# Altium schematic sheet Relay.SchDoc
size D; SheetNumber: 4; SheetTotal: 5
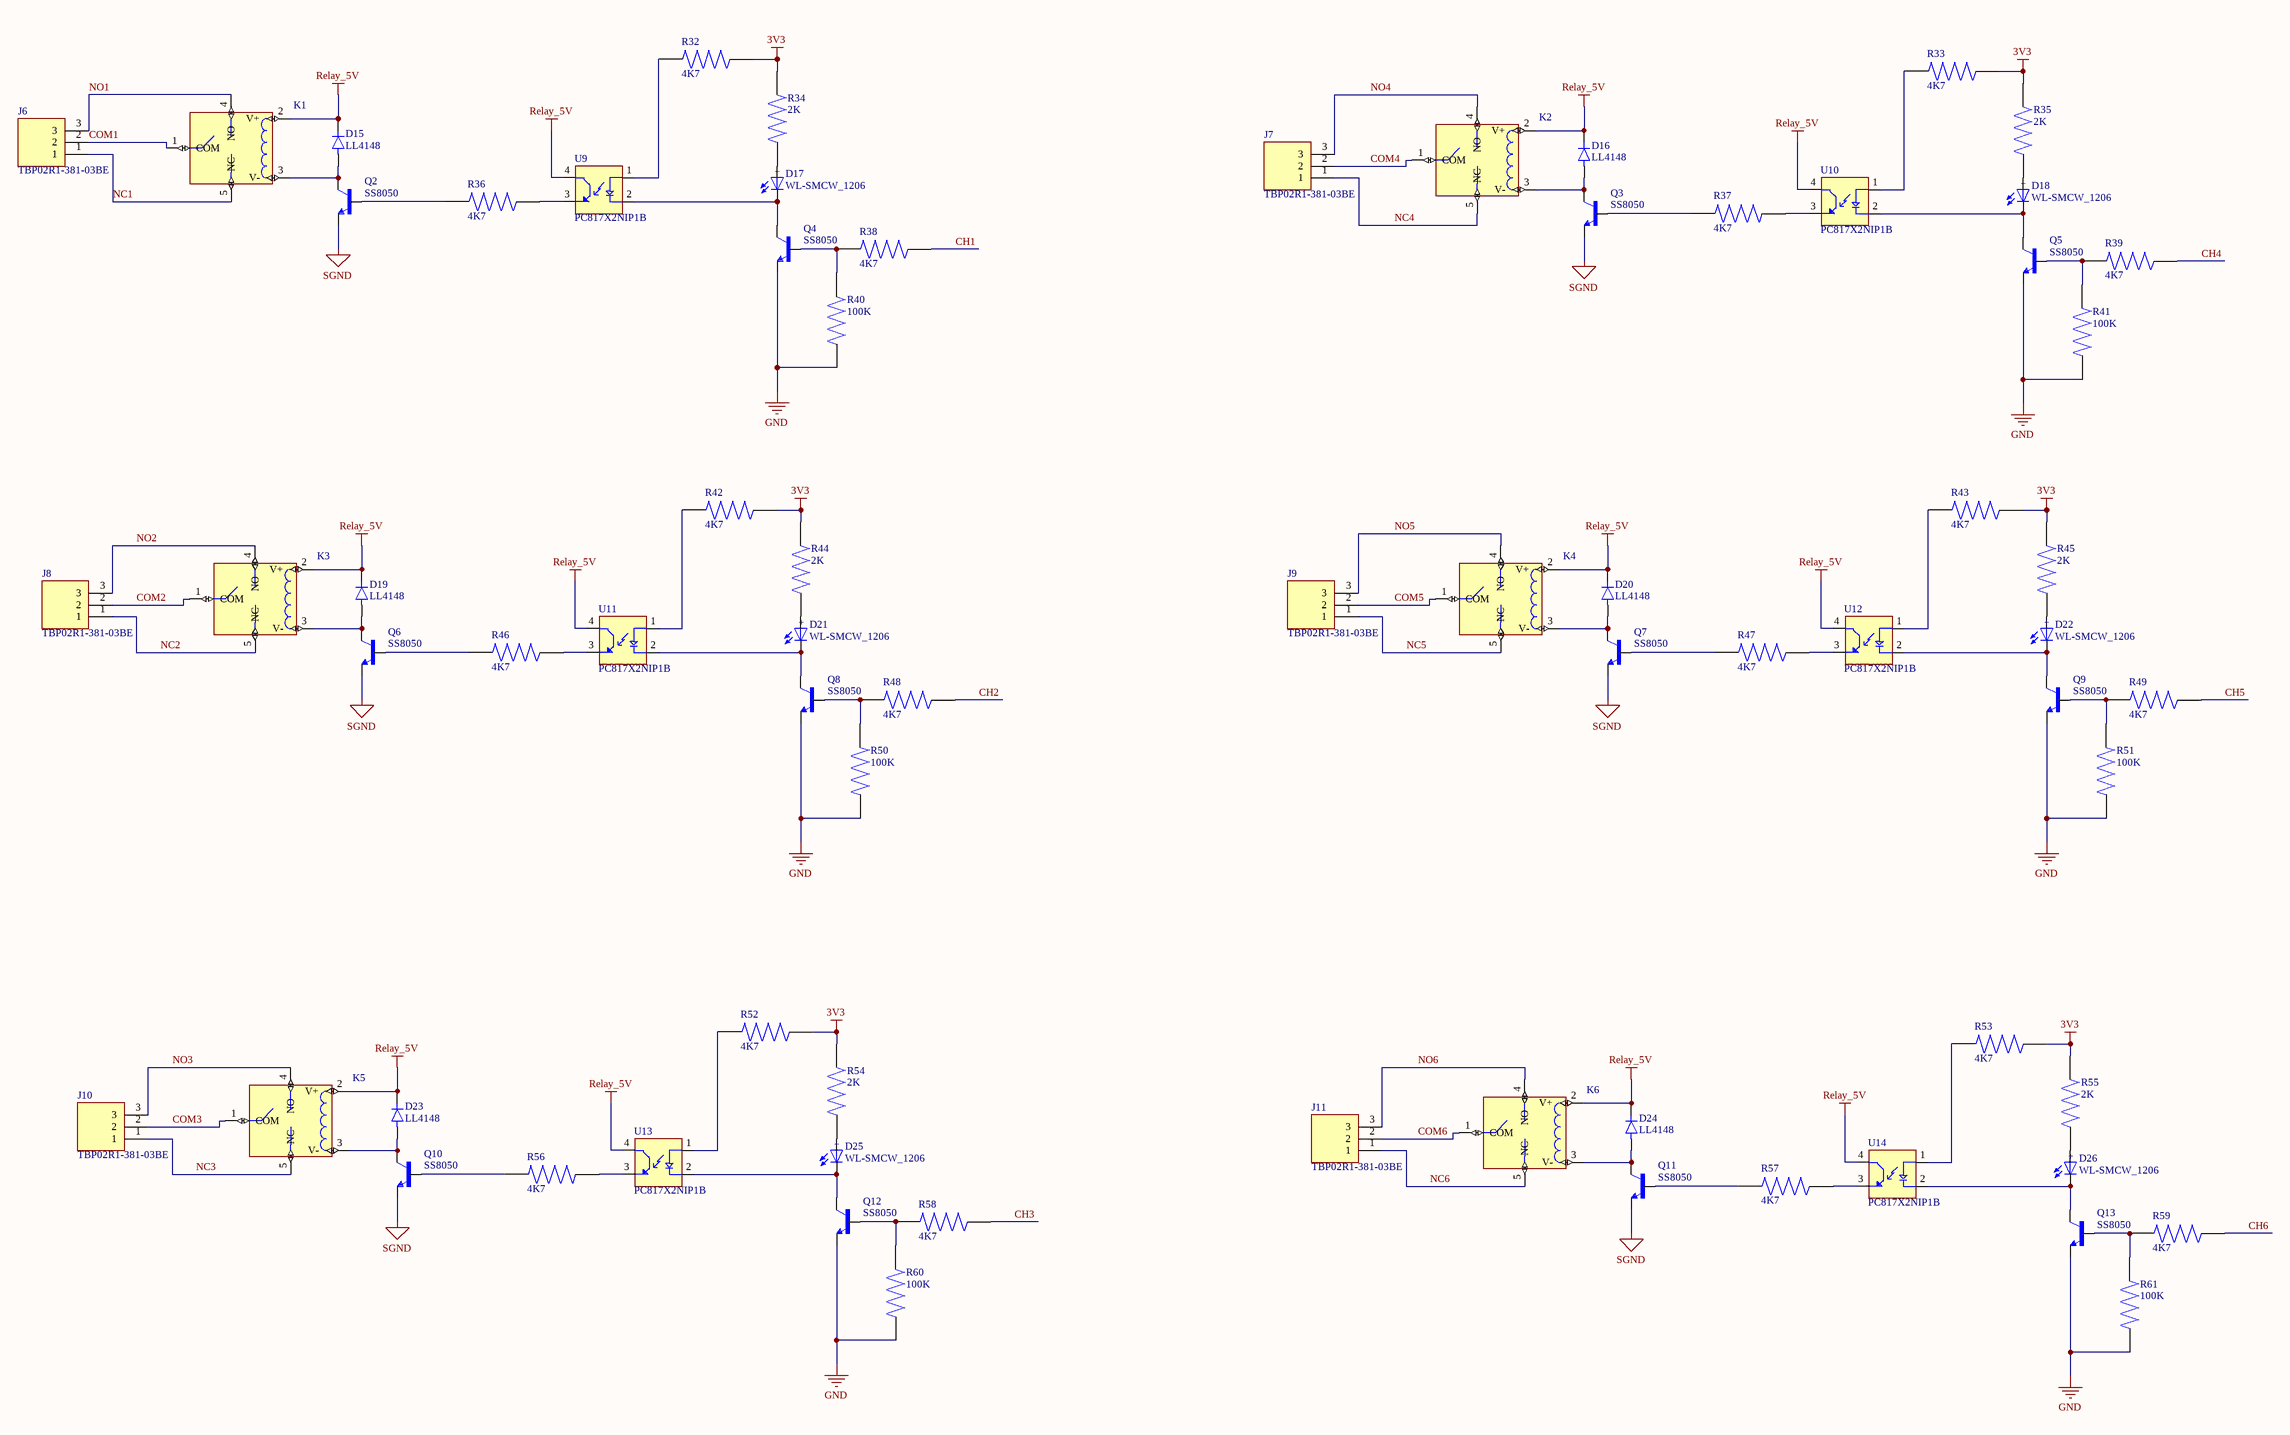
[diagram p0: Relay.SchDoc]

## Parts
D15  LL4148  [DIO_LL4148]
D16  LL4148  [DIO_LL4148]
D17  WL-SMCW_1206  [WL-SMCW_1206]
D18  WL-SMCW_1206  [WL-SMCW_1206]
D19  LL4148  [DIO_LL4148]
D20  LL4148  [DIO_LL4148]
D21  WL-SMCW_1206  [WL-SMCW_1206]
D22  WL-SMCW_1206  [WL-SMCW_1206]
D23  LL4148  [DIO_LL4148]
D24  LL4148  [DIO_LL4148]
D25  WL-SMCW_1206  [WL-SMCW_1206]
D26  WL-SMCW_1206  [WL-SMCW_1206]
J6  TBP02R1-381-03BE  [CUI_TBP02R1-381-03BE]
J7  TBP02R1-381-03BE  [CUI_TBP02R1-381-03BE]
J8  TBP02R1-381-03BE  [CUI_TBP02R1-381-03BE]
J9  TBP02R1-381-03BE  [CUI_TBP02R1-381-03BE]
J10  TBP02R1-381-03BE  [CUI_TBP02R1-381-03BE]
J11  TBP02R1-381-03BE  [CUI_TBP02R1-381-03BE]
K1  RELAY-HLS8L-DC5V-S-C(5P-19X15MM)  [REY5-19.0X15.0X15.0MM]  (value not drawn)
K2  RELAY-HLS8L-DC5V-S-C(5P-19X15MM)  [REY5-19.0X15.0X15.0MM]  (value not drawn)
K3  RELAY-HLS8L-DC5V-S-C(5P-19X15MM)  [REY5-19.0X15.0X15.0MM]  (value not drawn)
K4  RELAY-HLS8L-DC5V-S-C(5P-19X15MM)  [REY5-19.0X15.0X15.0MM]  (value not drawn)
K5  RELAY-HLS8L-DC5V-S-C(5P-19X15MM)  [REY5-19.0X15.0X15.0MM]  (value not drawn)
K6  RELAY-HLS8L-DC5V-S-C(5P-19X15MM)  [REY5-19.0X15.0X15.0MM]  (value not drawn)
Q2  SS8050  [SOT-23_BEC]
Q3  SS8050  [SOT-23_BEC]
Q4  SS8050  [SOT-23_BEC]
Q5  SS8050  [SOT-23_BEC]
Q6  SS8050  [SOT-23_BEC]
Q7  SS8050  [SOT-23_BEC]
Q8  SS8050  [SOT-23_BEC]
Q9  SS8050  [SOT-23_BEC]
Q10  SS8050  [SOT-23_BEC]
Q11  SS8050  [SOT-23_BEC]
Q12  SS8050  [SOT-23_BEC]
Q13  SS8050  [SOT-23_BEC]
R32  4K7  [RES_ERJU03J474V]
R33  4K7  [RES_ERJU03J474V]
R34  2K  [RES_ERJU03J474V]
R35  2K  [RES_ERJU03J474V]
R36  4K7  [RES_ERJU03J474V]
R37  4K7  [RES_ERJU03J474V]
R38  4K7  [RES_ERJU03J474V]
R39  4K7  [RES_ERJU03J474V]
R40  100K  [RES_ERJU03J474V]
R41  100K  [RES_ERJU03J474V]
R42  4K7  [RES_ERJU03J474V]
R43  4K7  [RES_ERJU03J474V]
R44  2K  [RES_ERJU03J474V]
R45  2K  [RES_ERJU03J474V]
R46  4K7  [RES_ERJU03J474V]
R47  4K7  [RES_ERJU03J474V]
R48  4K7  [RES_ERJU03J474V]
R49  4K7  [RES_ERJU03J474V]
R50  100K  [RES_ERJU03J474V]
R51  100K  [RES_ERJU03J474V]
R52  4K7  [RES_ERJU03J474V]
R53  4K7  [RES_ERJU03J474V]
R54  2K  [RES_ERJU03J474V]
R55  2K  [RES_ERJU03J474V]
R56  4K7  [RES_ERJU03J474V]
R57  4K7  [RES_ERJU03J474V]
R58  4K7  [RES_ERJU03J474V]
R59  4K7  [RES_ERJU03J474V]
R60  100K  [RES_ERJU03J474V]
R61  100K  [RES_ERJU03J474V]
U9  PC817X2NIP1B  [SOIC254P960X420-4N]
U10  PC817X2NIP1B  [SOIC254P960X420-4N]
U11  PC817X2NIP1B  [SOIC254P960X420-4N]
U12  PC817X2NIP1B  [SOIC254P960X420-4N]
U13  PC817X2NIP1B  [SOIC254P960X420-4N]
U14  PC817X2NIP1B  [SOIC254P960X420-4N]

## Nets
3V3: R32.1 R33.1 R34.1 R35.1 R42.1 R43.1 R44.1 R45.1 R52.1 R53.1 R54.1 R55.1
GND: Q4.E Q5.E Q8.E Q9.E Q12.E Q13.E R40.2 R41.2 R50.2 R51.2 R60.2 R61.2
Relay_5V: D15.C D16.C D19.C D20.C D23.C D24.C K1.2(V+) K2.2(V+) K3.2(V+) K4.2(V+) K5.2(V+) K6.2(V+) U9.4(CT) U10.4(CT) U11.4(CT) U12.4(CT) U13.4(CT) U14.4(CT)
SGND: Q2.E Q3.E Q6.E Q7.E Q10.E Q11.E
CH1: R38.1
CH2: R48.1
CH3: R58.1
CH4: R39.1
CH5: R49.1
CH6: R59.1
COM1: J6.2 K1.1(COM)
COM2: J8.2 K3.1(COM)
COM3: J10.2 K5.1(COM)
COM4: J7.2 K2.1(COM)
COM5: J9.2 K4.1(COM)
COM6: J11.2 K6.1(COM)
NC1: J6.1 K1.5(NC)
NC2: J8.1 K3.5(NC)
NC3: J10.1 K5.5(NC)
NC4: J7.1 K2.5(NC)
NC5: J9.1 K4.5(NC)
NC6: J11.1 K6.5(NC)
NO1: J6.3 K1.4(NO)
NO2: J8.3 K3.4(NO)
NO3: J10.3 K5.4(NO)
NO4: J7.3 K2.4(NO)
NO5: J9.3 K4.4(NO)
NO6: J11.3 K6.4(NO)
NetD15_A: D15.A K1.3(V-) Q2.C
NetD16_A: D16.A K2.3(V-) Q3.C
NetD17_1: D17.1(NEG) Q4.C U9.2(C)
NetD17_2: D17.2(POS) R34.2
NetD18_1: D18.1(NEG) Q5.C U10.2(C)
NetD18_2: D18.2(POS) R35.2
NetD19_A: D19.A K3.3(V-) Q6.C
NetD20_A: D20.A K4.3(V-) Q7.C
NetD21_1: D21.1(NEG) Q8.C U11.2(C)
NetD21_2: D21.2(POS) R44.2
NetD22_1: D22.1(NEG) Q9.C U12.2(C)
NetD22_2: D22.2(POS) R45.2
NetD23_A: D23.A K5.3(V-) Q10.C
NetD24_A: D24.A K6.3(V-) Q11.C
NetD25_1: D25.1(NEG) Q12.C U13.2(C)
NetD25_2: D25.2(POS) R54.2
NetD26_1: D26.1(NEG) Q13.C U14.2(C)
NetD26_2: D26.2(POS) R55.2
NetQ2_B: Q2.B R36.2
NetQ3_B: Q3.B R37.2
NetQ4_B: Q4.B R38.2 R40.1
NetQ5_B: Q5.B R39.2 R41.1
NetQ6_B: Q6.B R46.2
NetQ7_B: Q7.B R47.2
NetQ8_B: Q8.B R48.2 R50.1
NetQ9_B: Q9.B R49.2 R51.1
NetQ10_B: Q10.B R56.2
NetQ11_B: Q11.B R57.2
NetQ12_B: Q12.B R58.2 R60.1
NetQ13_B: Q13.B R59.2 R61.1
NetR32_2: R32.2 U9.1(A)
NetR33_2: R33.2 U10.1(A)
NetR36_1: R36.1 U9.3(ET)
NetR37_1: R37.1 U10.3(ET)
NetR42_2: R42.2 U11.1(A)
NetR43_2: R43.2 U12.1(A)
NetR46_1: R46.1 U11.3(ET)
NetR47_1: R47.1 U12.3(ET)
NetR52_2: R52.2 U13.1(A)
NetR53_2: R53.2 U14.1(A)
NetR56_1: R56.1 U13.3(ET)
NetR57_1: R57.1 U14.3(ET)

## Notes on the sheet
- (in symbol WL-SMCW_1206) +

## Library data of the parts
D15 D16 D19 D20 D23 D24 = LL4148: Small Signal Diode, SOD-80, 100V, 0.15A, 175Â°C; MF: Diotec Semiconductor; SnapEDA_Link: https://www.snapeda.com/parts/LL4148/Diotec/view-part/?ref=snap; Package: SOD-80 Diotec; Value: *; MP: LL4148; Check_prices: https://www.snapeda.com/parts/LL4148/Diotec/view-part/?ref=eda
D17 D18 D21 D22 D25 D26 = WL-SMCW_1206: 1206, Blue Typ.(@20mA): 470nm, 145mcd, 3.2V, 140Â° InGaN; MF: Wurth Electronics; MP: 150120BS75000; SnapEDA_Link: https://www.snapeda.com/parts/150120BS75000/Wurth+Electronics/view-part/?ref=snap; Package: 1206 Wurth Electronics; Value: *; Check_prices: https://www.snapeda.com/parts/150120BS75000/Wurth+Electronics/view-part/?ref=eda
J6-J11 = TBP02R1-381-03BE: 2~24 Poles, Pluggable,Receptacle, Horizontal, 3.81 Pitch, Terminal Block Connector; MF: Same Sky; SnapEDA_Link: https://www.snapeda.com/parts/TBP02R1-381-03BE/Same+Sky/view-part/?ref=snap; Package: None; Value: *; MP: TBP02R1-381-03BE; Check_prices: https://www.snapeda.com/parts/TBP02R1-381-03BE/Same+Sky/view-part/?ref=eda
K1-K6 = RELAY-HLS8L-DC5V-S-C(5P-19X15MM): DIP Power Relay 5V-7A;; MF: Helishun; SnapEDA_Link: https://www.snapeda.com/parts/HLS8L-DC5V-S-C/Helishun/view-part/?ref=snap; Package: None; Value: *; MP: HLS8L-DC5V-S-C; Check_prices: https://www.snapeda.com/parts/HLS8L-DC5V-S-C/Helishun/view-part/?ref=eda
Q2-Q13 = SS8050: NPN Epitaxial Silicon Transistor; MF: ON Semiconductor / Fairchild; SnapEDA_Link: https://www.snapeda.com/parts/SS8050/Fairchild+Semiconductor/view-part/?ref=snap; Package: TO-92-3 ON Semiconductor; Value: *; MP: SS8050; Check_prices: https://www.snapeda.com/parts/SS8050/Fairchild+Semiconductor/view-part/?ref=eda
R32-R61 = res_0603_ERJU03J474V: 0603 Anti-Sulfurated; MF: Panasonic; SnapEDA_Link: https://www.snapeda.com/parts/ERJU03J474V/Panasonic/view-part/?ref=snap; Package: 1608-2 Panasonic; Value: *; MP: ERJU03J474V; Check_prices: https://www.snapeda.com/parts/ERJU03J474V/Panasonic/view-part/?ref=eda
U9-U14 = PC817X2NIP1B: Optocoupler DC-IN 1-CH Transistor DC-OUT 4-Pin DIP SMD T/R; MF: Sharp Microelectronics; SnapEDA_Link: https://www.snapeda.com/parts/PC817X2NIP1B/Sharp+Microelectronics/view-part/?ref=snap; Package: SMD-4 Sharp Microelectronics; Value: *; MP: PC817X2NIP1B; Check_prices: https://www.snapeda.com/parts/PC817X2NIP1B/Sharp+Microelectronics/view-part/?ref=eda